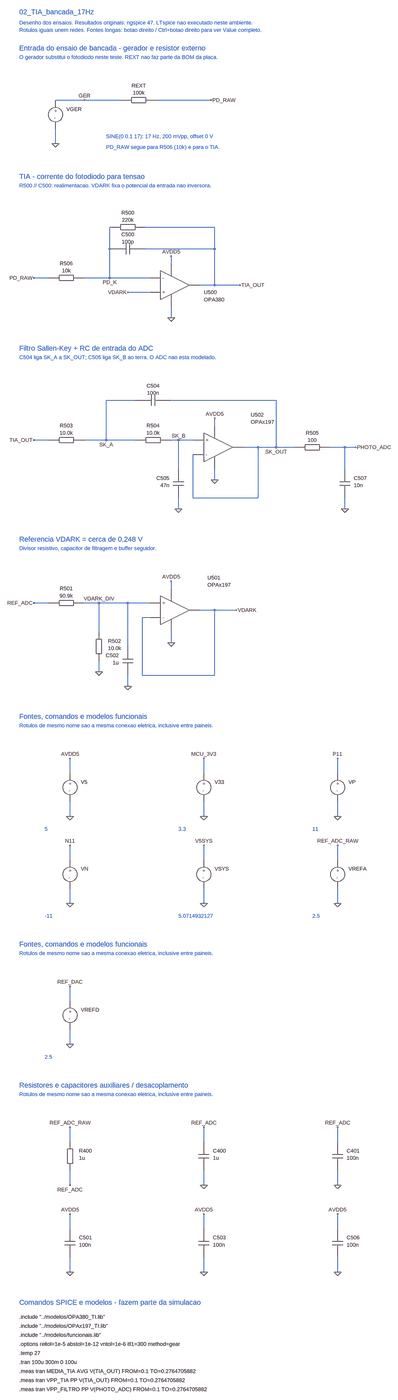
[diagram p0: schematic 02_TIA_bancada_17Hz.asc, whole sheet]
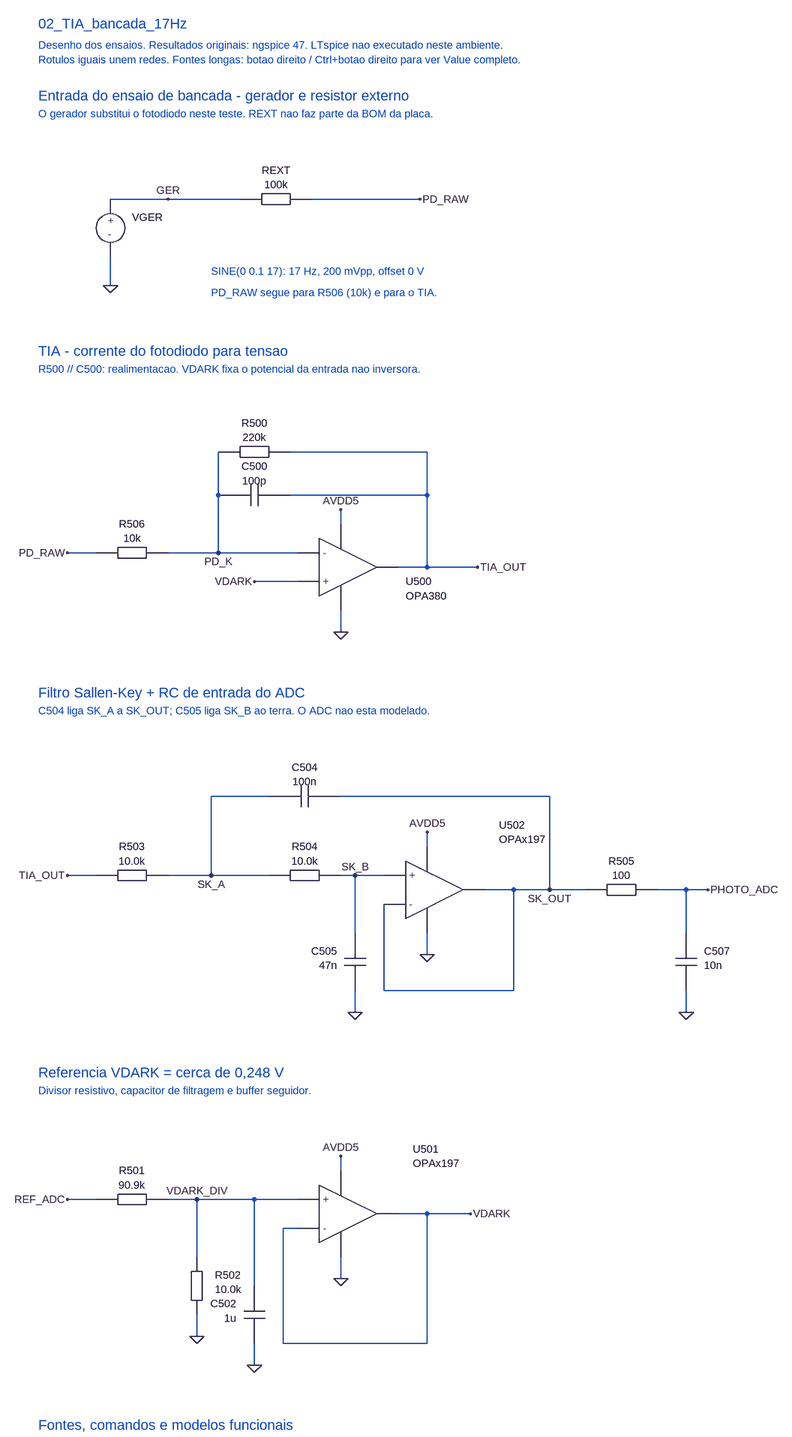
[diagram p1: schematic 02_TIA_bancada_17Hz.asc, part, row 1 of 2, column 1 of 1]
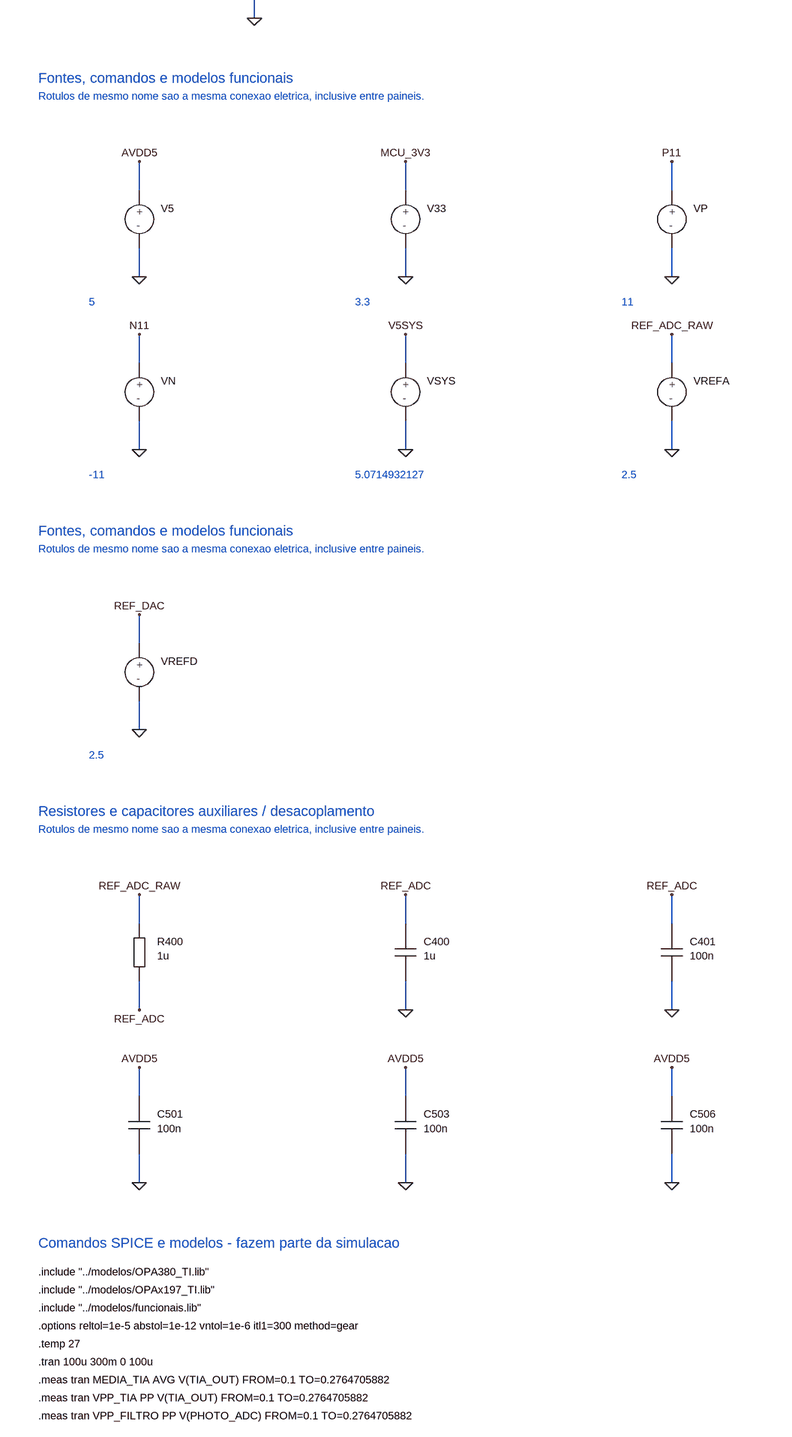
[diagram p2: schematic 02_TIA_bancada_17Hz.asc, part, row 2 of 2, column 1 of 1]
02_TIA_bancada_17Hz.asc, the LTspice schematic file:
Version 4.1
SHEET 1 1968 7448
TEXT 64 32 Left 3 ;02_TIA_bancada_17Hz
TEXT 64 80 Left 2 ;Desenho dos ensaios. Resultados originais: ngspice 47. LTspice nao executado neste ambiente.
TEXT 64 112 Left 2 ;Rotulos iguais unem redes. Fontes longas: botao direito / Ctrl+botao direito para ver Value completo.
TEXT 64 192 Left 3 ;Entrada do ensaio de bancada - gerador e resistor externo
TEXT 64 232 Left 2 ;O gerador substitui o fotodiodo neste teste. REXT nao faz parte da BOM da placa.
WIRE 224 512 512 512
WIRE 672 512 912 512
WIRE 224 640 224 704
FLAG 352 512 GER
FLAG 912 512 PD_RAW
FLAG 224 704 0
SYMBOL CV_V 224 512 R0
SYMATTR InstName VGER
SYMATTR Value SINE(0 0.1 17)
SYMBOL CV_RH 512 512 R0
SYMATTR InstName REXT
SYMATTR Value 100k
TEXT 448 672 Left 2 ;SINE(0 0.1 17): 17 Hz, 200 mVpp, offset 0 V
TEXT 448 720 Left 2 ;PD_RAW segue para R506 (10k) e para o TIA.
TEXT 64 1008 Left 3 ;TIA - corrente do fotodiodo para tensao
TEXT 64 1048 Left 2 ;R500 // C500: realimentacao. VDARK fixa o potencial da entrada nao inversora.
WIRE 192 1456 128 1456
WIRE 352 1456 640 1456
WIRE 464 1456 464 1232
WIRE 624 1232 928 1232
WIRE 928 1232 928 1488
WIRE 928 1488 864 1488
WIRE 624 1328 928 1328
WIRE 736 1392 736 1360
WIRE 736 1584 736 1632
WIRE 640 1520 544 1520
WIRE 928 1488 1040 1488
FLAG 128 1456 PD_RAW
FLAG 736 1360 AVDD5
FLAG 736 1632 0
FLAG 544 1520 VDARK
FLAG 1040 1488 TIA_OUT
FLAG 464 1456 PD_K
SYMBOL CV_RH 192 1456 R0
SYMATTR InstName R506
SYMATTR Value 10k
SYMBOL CV_RH 464 1232 R0
SYMATTR InstName R500
SYMATTR Value 220k
SYMBOL CV_CH 464 1328 R0
SYMATTR InstName C500
SYMATTR Value 100p
SYMBOL CV_OPD 704 1424 R0
SYMATTR InstName U500
SYMATTR Value OPA380
TEXT 64 1952 Left 3 ;Filtro Sallen-Key + RC de entrada do ADC
TEXT 64 1992 Left 2 ;C504 liga SK_A a SK_OUT; C505 liga SK_B ao terra. O ADC nao esta modelado.
WIRE 192 2368 128 2368
WIRE 352 2368 576 2368
WIRE 448 2368 448 2192
WIRE 448 2192 576 2192
WIRE 736 2192 1200 2192
WIRE 1200 2192 1200 2400
WIRE 928 2304 928 2272
WIRE 928 2496 928 2544
WIRE 736 2368 832 2368
WIRE 768 2368 768 2496
WIRE 768 2624 768 2672
WIRE 832 2432 832 2624
WIRE 832 2624 1120 2624
WIRE 1120 2624 1120 2400
WIRE 1056 2400 1280 2400
WIRE 1440 2400 1552 2400
WIRE 1504 2400 1504 2496
WIRE 1504 2624 1504 2672
FLAG 128 2368 TIA_OUT
FLAG 928 2272 AVDD5
FLAG 928 2544 0
FLAG 768 2672 0
FLAG 1552 2400 PHOTO_ADC
FLAG 1504 2672 0
FLAG 448 2368 SK_A
FLAG 768 2368 SK_B
FLAG 1200 2400 SK_OUT
SYMBOL CV_RH 192 2368 R0
SYMATTR InstName R503
SYMATTR Value 10.0k
SYMBOL CV_RH 576 2368 R0
SYMATTR InstName R504
SYMATTR Value 10.0k
SYMBOL CV_CH 576 2192 R0
SYMATTR InstName C504
SYMATTR Value 100n
SYMBOL CV_OPF 896 2336 R0
SYMATTR InstName U502
SYMATTR Value OPAx197
SYMBOL CV_CVL 768 2496 R0
SYMATTR InstName C505
SYMATTR Value 47n
SYMBOL CV_RH 1280 2400 R0
SYMATTR InstName R505
SYMATTR Value 100
SYMBOL CV_CV 1504 2496 R0
SYMATTR InstName C507
SYMATTR Value 10n
TEXT 64 2896 Left 3 ;Referencia VDARK = cerca de 0,248 V
TEXT 64 2936 Left 2 ;Divisor resistivo, capacitor de filtragem e buffer seguidor.
WIRE 192 3248 128 3248
WIRE 352 3248 640 3248
WIRE 416 3248 416 3376
WIRE 416 3504 416 3552
WIRE 544 3248 544 3440
WIRE 544 3568 544 3616
WIRE 736 3184 736 3152
WIRE 736 3376 736 3424
WIRE 640 3312 608 3312
WIRE 608 3312 608 3568
WIRE 608 3568 928 3568
WIRE 928 3568 928 3280
WIRE 928 3280 864 3280
WIRE 928 3280 1024 3280
FLAG 128 3248 REF_ADC
FLAG 416 3552 0
FLAG 544 3616 0
FLAG 736 3152 AVDD5
FLAG 736 3424 0
FLAG 1024 3280 VDARK
FLAG 416 3248 VDARK_DIV
SYMBOL CV_RH 192 3248 R0
SYMATTR InstName R501
SYMATTR Value 90.9k
SYMBOL CV_RV 416 3376 R0
SYMATTR InstName R502
SYMATTR Value 10.0k
SYMBOL CV_CVL 544 3440 R0
SYMATTR InstName C502
SYMATTR Value 1u
SYMBOL CV_OPF 704 3216 R0
SYMATTR InstName U501
SYMATTR Value OPAx197
TEXT 64 3856 Left 3 ;Fontes, comandos e modelos funcionais
TEXT 64 3896 Left 2 ;Rotulos de mesmo nome sao a mesma conexao eletrica, inclusive entre paineis.
WIRE 288 4176 288 4112
WIRE 288 4304 288 4368
WIRE 880 4176 880 4112
WIRE 880 4304 880 4368
WIRE 1472 4176 1472 4112
WIRE 1472 4304 1472 4368
WIRE 288 4560 288 4496
WIRE 288 4688 288 4752
WIRE 880 4560 880 4496
WIRE 880 4688 880 4752
WIRE 1472 4560 1472 4496
WIRE 1472 4688 1472 4752
FLAG 288 4112 AVDD5
FLAG 288 4368 0
FLAG 880 4112 MCU_3V3
FLAG 880 4368 0
FLAG 1472 4112 P11
FLAG 1472 4368 0
FLAG 288 4496 N11
FLAG 288 4752 0
FLAG 880 4496 V5SYS
FLAG 880 4752 0
FLAG 1472 4496 REF_ADC_RAW
FLAG 1472 4752 0
SYMBOL CV_V 288 4176 R0
SYMATTR InstName V5
SYMATTR Value 5
SYMBOL CV_V 880 4176 R0
SYMATTR InstName V33
SYMATTR Value 3.3
SYMBOL CV_V 1472 4176 R0
SYMATTR InstName VP
SYMATTR Value 11
SYMBOL CV_V 288 4560 R0
SYMATTR InstName VN
SYMATTR Value -11
SYMBOL CV_V 880 4560 R0
SYMATTR InstName VSYS
SYMATTR Value 5.0714932127
SYMBOL CV_V 1472 4560 R0
SYMATTR InstName VREFA
SYMATTR Value 2.5
TEXT 176 4424 Left 2 ;5
TEXT 768 4424 Left 2 ;3.3
TEXT 1360 4424 Left 2 ;11
TEXT 176 4808 Left 2 ;-11
TEXT 768 4808 Left 2 ;5.0714932127
TEXT 1360 4808 Left 2 ;2.5
TEXT 64 5008 Left 3 ;Fontes, comandos e modelos funcionais
TEXT 64 5048 Left 2 ;Rotulos de mesmo nome sao a mesma conexao eletrica, inclusive entre paineis.
WIRE 288 5328 288 5264
WIRE 288 5456 288 5520
FLAG 288 5264 REF_DAC
FLAG 288 5520 0
SYMBOL CV_V 288 5328 R0
SYMATTR InstName VREFD
SYMATTR Value 2.5
TEXT 176 5576 Left 2 ;2.5
TEXT 64 5776 Left 3 ;Resistores e capacitores auxiliares / desacoplamento
TEXT 64 5816 Left 2 ;Rotulos de mesmo nome sao a mesma conexao eletrica, inclusive entre paineis.
WIRE 288 6096 288 6032
WIRE 288 6224 288 6288
WIRE 880 6096 880 6032
WIRE 880 6224 880 6288
WIRE 1472 6096 1472 6032
WIRE 1472 6224 1472 6288
WIRE 288 6480 288 6416
WIRE 288 6608 288 6672
WIRE 880 6480 880 6416
WIRE 880 6608 880 6672
WIRE 1472 6480 1472 6416
WIRE 1472 6608 1472 6672
FLAG 288 6032 REF_ADC_RAW
FLAG 288 6288 REF_ADC
FLAG 880 6032 REF_ADC
FLAG 880 6288 0
FLAG 1472 6032 REF_ADC
FLAG 1472 6288 0
FLAG 288 6416 AVDD5
FLAG 288 6672 0
FLAG 880 6416 AVDD5
FLAG 880 6672 0
FLAG 1472 6416 AVDD5
FLAG 1472 6672 0
SYMBOL CV_RV 288 6096 R0
SYMATTR InstName R400
SYMATTR Value 1u
SYMBOL CV_CV 880 6096 R0
SYMATTR InstName C400
SYMATTR Value 1u
SYMBOL CV_CV 1472 6096 R0
SYMATTR InstName C401
SYMATTR Value 100n
SYMBOL CV_CV 288 6480 R0
SYMATTR InstName C501
SYMATTR Value 100n
SYMBOL CV_CV 880 6480 R0
SYMATTR InstName C503
SYMATTR Value 100n
SYMBOL CV_CV 1472 6480 R0
SYMATTR InstName C506
SYMATTR Value 100n
TEXT 64 6928 Left 3 ;Comandos SPICE e modelos - fazem parte da simulacao
TEXT 64 6992 Left 2 !.include "../modelos/OPA380_TI.lib"
TEXT 64 7032 Left 2 !.include "../modelos/OPAx197_TI.lib"
TEXT 64 7072 Left 2 !.include "../modelos/funcionais.lib"
TEXT 64 7112 Left 2 !.options reltol=1e-5 abstol=1e-12 vntol=1e-6 itl1=300 method=gear
TEXT 64 7152 Left 2 !.temp 27
TEXT 64 7192 Left 2 !.tran 100u 300m 0 100u
TEXT 64 7232 Left 2 !.meas tran MEDIA_TIA AVG V(TIA_OUT) FROM=0.1 TO=0.2764705882
TEXT 64 7272 Left 2 !.meas tran VPP_TIA PP V(TIA_OUT) FROM=0.1 TO=0.2764705882
TEXT 64 7312 Left 2 !.meas tran VPP_FILTRO PP V(PHOTO_ADC) FROM=0.1 TO=0.2764705882

The netlist it stands for:
* 02_TIA_bancada_17Hz.asc
VGER GER 0 SINE(0 0.1 17)
REXT GER PD_RAW 100k
R506 PD_RAW PD_K 10k
R500 PD_K TIA_OUT 220k
C500 PD_K TIA_OUT 100p
X§U500 VDARK PD_K AVDD5 0 TIA_OUT OPA380  ; pins + - V+ V- OUT
R503 TIA_OUT SK_A 10.0k
R504 SK_A SK_B 10.0k
C504 SK_A SK_OUT 100n
X§U502 SK_B SK_OUT AVDD5 0 SK_OUT OPAx197  ; pins + - V+ V- OUT
C505 SK_B 0 47n
R505 SK_OUT PHOTO_ADC 100
C507 PHOTO_ADC 0 10n
R501 REF_ADC VDARK_DIV 90.9k
R502 VDARK_DIV 0 10.0k
C502 VDARK_DIV 0 1u
X§U501 VDARK_DIV VDARK AVDD5 0 VDARK OPAx197  ; pins + - V+ V- OUT
V5 AVDD5 0 5
V33 MCU_3V3 0 3.3
VP P11 0 11
VN N11 0 -11
VSYS V5SYS 0 5.0714932127
VREFA REF_ADC_RAW 0 2.5
VREFD REF_DAC 0 2.5
R400 REF_ADC_RAW REF_ADC 1u
C400 REF_ADC 0 1u
C401 REF_ADC 0 100n
C501 AVDD5 0 100n
C503 AVDD5 0 100n
C506 AVDD5 0 100n
* 02_TIA_bancada_17Hz
* Desenho dos ensaios. Resultados originais: ngspice 47. LTspice nao executado neste ambiente.
* Rotulos iguais unem redes. Fontes longas: botao direito / Ctrl+botao direito para ver Value completo.
* Entrada do ensaio de bancada - gerador e resistor externo
* O gerador substitui o fotodiodo neste teste. REXT nao faz parte da BOM da placa.
* SINE(0 0.1 17): 17 Hz, 200 mVpp, offset 0 V
* PD_RAW segue para R506 (10k) e para o TIA.
* TIA - corrente do fotodiodo para tensao
* R500 // C500: realimentacao. VDARK fixa o potencial da entrada nao inversora.
* Filtro Sallen-Key + RC de entrada do ADC
* C504 liga SK_A a SK_OUT; C505 liga SK_B ao terra. O ADC nao esta modelado.
* Referencia VDARK = cerca de 0,248 V
* Divisor resistivo, capacitor de filtragem e buffer seguidor.
* Fontes, comandos e modelos funcionais
* Rotulos de mesmo nome sao a mesma conexao eletrica, inclusive entre paineis.
* 5
* 3.3
* 11
* -11
* 5.0714932127
* 2.5
* Fontes, comandos e modelos funcionais
* Rotulos de mesmo nome sao a mesma conexao eletrica, inclusive entre paineis.
* 2.5
* Resistores e capacitores auxiliares / desacoplamento
* Rotulos de mesmo nome sao a mesma conexao eletrica, inclusive entre paineis.
* Comandos SPICE e modelos - fazem parte da simulacao
.include "../modelos/OPA380_TI.lib"
.include "../modelos/OPAx197_TI.lib"
.include "../modelos/funcionais.lib"
.options reltol=1e-5 abstol=1e-12 vntol=1e-6 itl1=300 method=gear
.temp 27
.tran 100u 300m 0 100u
.meas tran MEDIA_TIA AVG V(TIA_OUT) FROM=0.1 TO=0.2764705882
.meas tran VPP_TIA PP V(TIA_OUT) FROM=0.1 TO=0.2764705882
.meas tran VPP_FILTRO PP V(PHOTO_ADC) FROM=0.1 TO=0.2764705882
.backanno
.end